# EasyEDA Pro project ZeroFactorySensorBoard_Board_DHT_2026-11-01.epro

# Schematic Schematic1
Board Name: Board_DHT; Create Date: 2026-02-08; Page Name: P1; Project Name: ZeroFactorySensorBoard; Schematic Name: Schematic1; Update Date: 2026-03-15; Company: EasyEDA.com; Page Size: A4; Version: V1.0
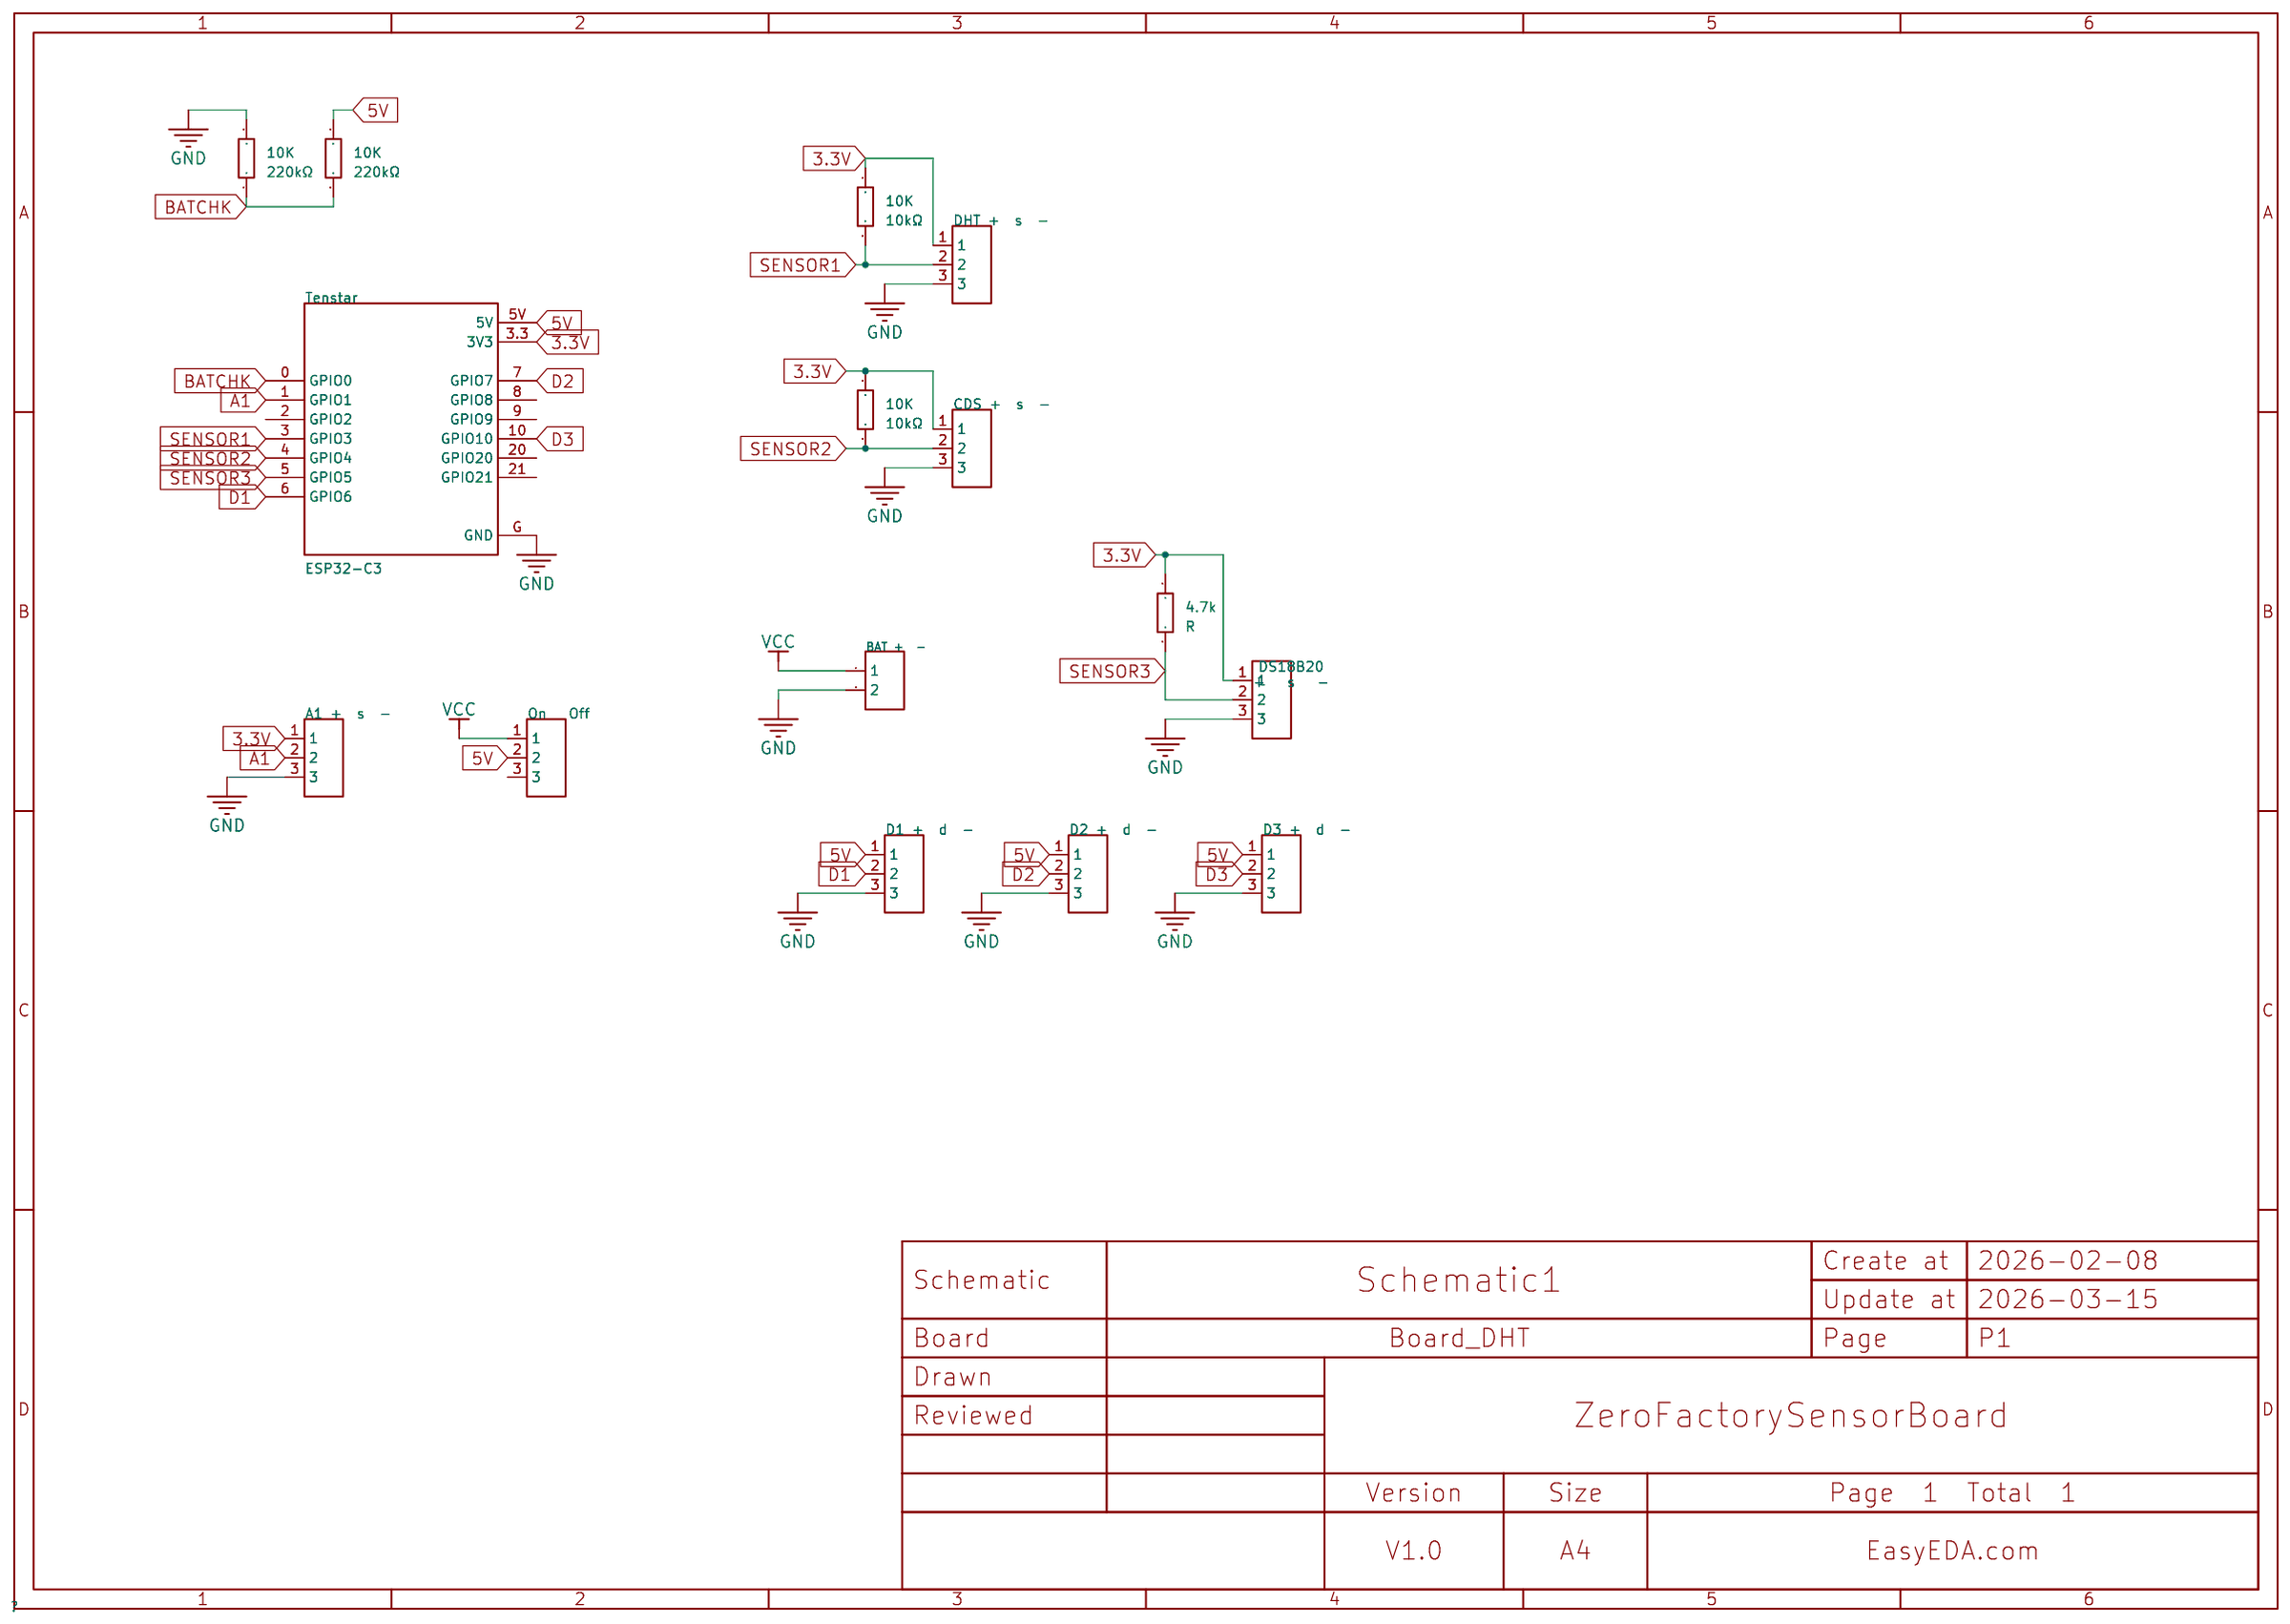
[diagram p0: schematic sheet]

## Parts
4.7k  4.7kΩ  [RES-TH_BD1.8-L3.2-P7.20-D0.4]
10K  10kΩ  [RES-TH_BD1.8-L3.2-P7.20-D0.4]
10K#2  10kΩ  [RES-TH_BD1.8-L3.2-P7.20-D0.4]
10K#3  220kΩ  [RES-TH_BD1.8-L3.2-P7.20-D0.4]
10K#4  220kΩ  [RES-TH_BD1.8-L3.2-P7.20-D0.4]
A1 +  s  -  -  [HDR-TH_3P-P2.54-V-F]
BAT +  -  -  [HDR-TH_2P-P2.54-V-F]
CDS +  s  -  -  [HDR-TH_3P-P2.54-V-M]
D1 +  d  -  -  [HDR-TH_3P-P2.54-V-F]
D2 +  d  -  -  [HDR-TH_3P-P2.54-V-F]
D3 +  d  -  -  [HDR-TH_3P-P2.54-V-F]
DHT +  s  -  -  [HDR-TH_3P-P2.54-V-M]
DS18B20
+   s   -  -  [HDR-TH_3P-P2.54-V-M]
On   Off  -  [HDR-TH_3P-P2.54-V-F]
Tenstar  ESP32-C3_SUPERMINI_TH  [ESP32-C3_SUPERMINI_TH:MODULE_ESP32-C3_SUPERMINI]

## Library data of the parts
4.7k 10K 10K#2-10K#4 = Res_AXIAL-1/8W: Supplier Footprint: Through
A1 +  s  - D1 +  d  - D2 +  d  - D3 +  d  - On   Off = HDR-F_2.54_1x3P: Supplier Footprint: Through
BAT +  - = HDR-F_2.54_1x2P: Supplier Footprint: Through
CDS +  s  - DHT +  s  - DS18B20
+   s   - = HDR-M_2.54_1x3P: Supplier Footprint: Through
Tenstar = ESP32-C3_SUPERMINI_TH_ESP32-C3_SUPERMINI_TH: MF: Espressif Systems; MAXIMUM_PACKAGE_HEIGHT: 4.2mm; Package1: Package; Price: None; Check_prices: https://www.snapeda.com/parts/ESP32-C3%20SuperMini_TH/Espressif+Systems/view-part/?ref=eda; STANDARD: Manufacturer Recommendations; SnapEDA_Link: https://www.snapeda.com/parts/ESP32-C3%20SuperMini_TH/Espressif+Systems/view-part/?ref=snap; MP: ESP32-C3 SuperMini_TH; Description_1: \n                        \n                            Super tiny ESP32-C3 board\n                        \n; Availability: Not in stock; MANUFACTURER: Espressif

## Nets
3.3V: 4.7k.2 10K.1 10K#2.1 A1 +  s  -.1 CDS +  s  -.1 DHT +  s  -.1 DS18B20
+   s   -.1 Tenstar.3.3(3V3)
5V: 10K#3.1 D1 +  d  -.1 D2 +  d  -.1 D3 +  d  -.1 On   Off.2 Tenstar.5V
GND: 10K#4.2 A1 +  s  -.3 BAT +  -.2 CDS +  s  -.3 D1 +  d  -.3 D2 +  d  -.3 D3 +  d  -.3 DHT +  s  -.3 DS18B20
+   s   -.3 Tenstar.G(GND)
VCC: BAT +  -.1 On   Off.1
A1: A1 +  s  -.2 Tenstar.1(GPIO1)
BATCHK: 10K#3.2 10K#4.1 Tenstar.0(GPIO0)
D1: D1 +  d  -.2 Tenstar.6(GPIO6)
D2: D2 +  d  -.2 Tenstar.7(GPIO7)
D3: D3 +  d  -.2 Tenstar.10(GPIO10)
SENSOR1: 10K.2 DHT +  s  -.2 Tenstar.3(GPIO3)
SENSOR2: 10K#2.2 CDS +  s  -.2 Tenstar.4(GPIO4)
SENSOR3: 4.7k.1 DS18B20
+   s   -.2 Tenstar.5(GPIO5)

Not connected (* = marked no-connect by the designer): On   Off 3; Tenstar 2(GPIO2) 8(GPIO8) 9(GPIO9) 20(GPIO20) 21(GPIO21)

# Board PCB1
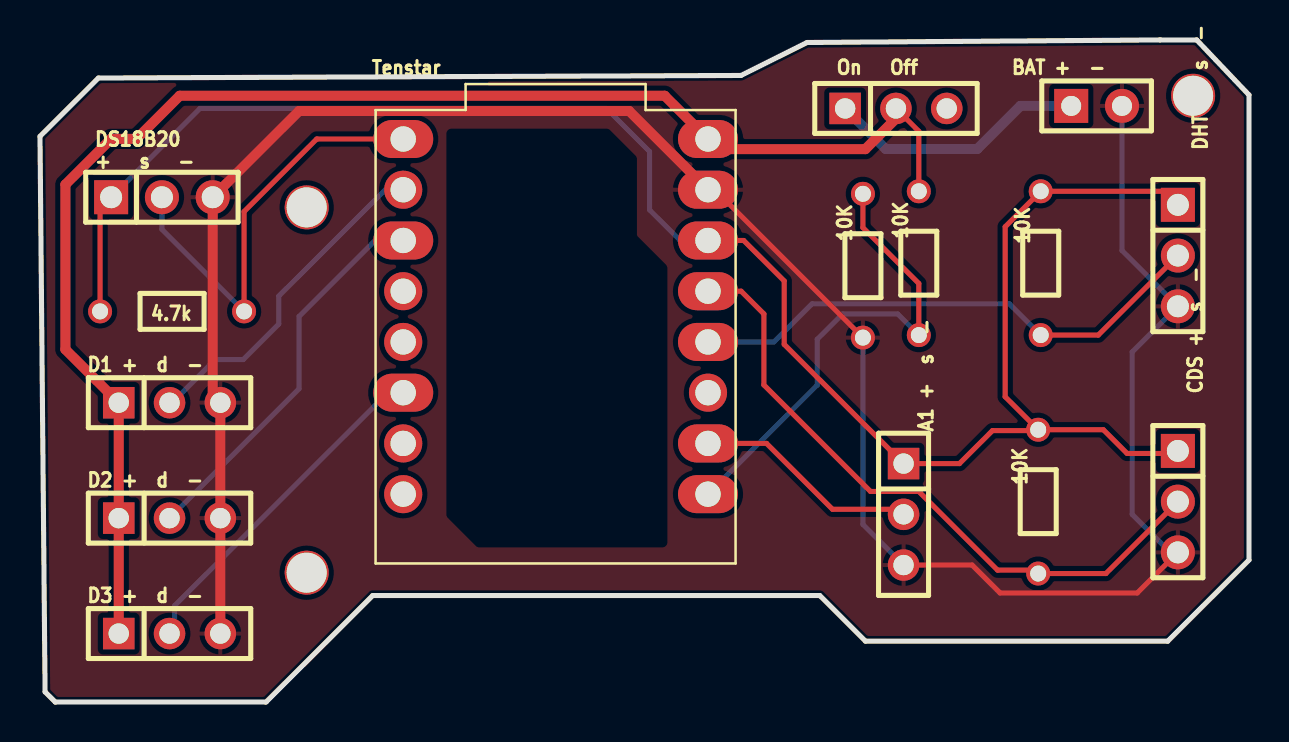
[diagram p1: board, top side]
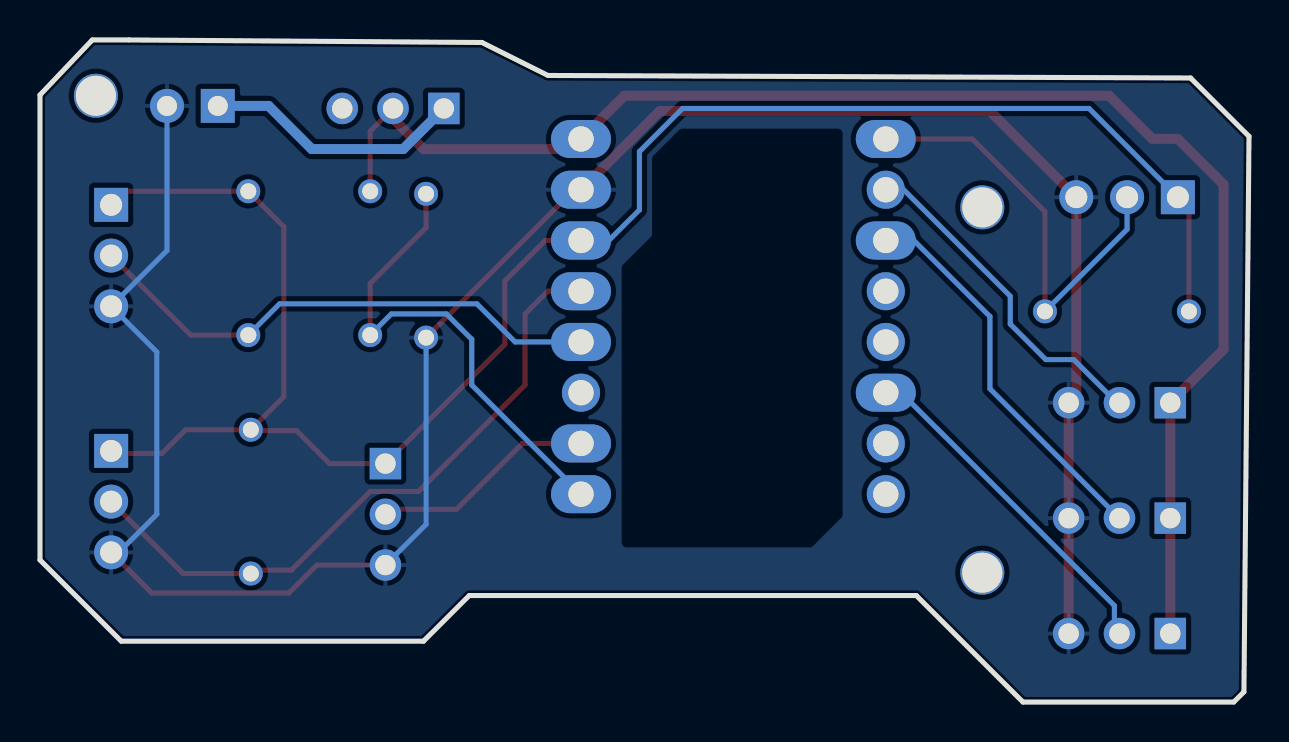
[diagram p2: board, bottom side, seen from below]

Outline 60.45 x 33.15 mm; copper layers: Top Layer, Bottom Layer. Coordinates in mm from the lower left corner of the outline.
Outline path: 0,28.32 2.92,31.24 35.05,31.37 38.35,33.02 56.01,33.15 57.84,33.15 60.45,30.39 60.45,7.11 56.39,3.05 41.28,3.05 38.99,5.33 16.64,5.33 11.3,0 0.76,0 0.25,0.51 0,28.32
Stack: Top Layer 0.035mm / Dielectric1 1.51mm FR4 er 4.5 / Bottom Layer 0.035mm

## Design rules (mm)
spacing copperThickness1oz (default): track to track 0.102, other pairs 0.152 to 0.3
spacing copperThickness2oz: track to track 0.203, other pairs 0.152 to 0.3
spacing Plane_innerPlane: track to track 0.102, other pairs 0.152 to 0.3
spacing Copper_copperRegion: track to track 0.102, other pairs 0.152 to 0.3
track width copperThickness1oz (default): min 0.127, default 0.254, max 2.54
track width copperThickness2oz: min 0.203, default 0.254, max 2.54
differential pair differentialPair (default): width min 0.127, default 0.254, max 2.54; gap min 0.152, default 0.152
net GND uses Copper_copperRegion, Plane_innerPlane
net SENSOR1 uses Copper_copperRegion, Plane_innerPlane
net 3.3V uses Copper_copperRegion, Plane_innerPlane
net A1 uses Copper_copperRegion, Plane_innerPlane
net SENSOR2 uses Copper_copperRegion, Plane_innerPlane
net SENSOR3 uses Copper_copperRegion, Plane_innerPlane
net 5V uses Copper_copperRegion, Plane_innerPlane
net D1 uses Copper_copperRegion, Plane_innerPlane
net D2 uses Copper_copperRegion, Plane_innerPlane
net D3 uses Copper_copperRegion, Plane_innerPlane
net VCC uses Copper_copperRegion, Plane_innerPlane
net BATCHK uses Copper_copperRegion, Plane_innerPlane
pour e118 uses Copper_copperRegion
pour e158 uses Copper_copperRegion

## Placement (name value [footprint] x y rotation side)
4.7k  4.7kΩ  [RES-TH_BD1.8-L3.2-P7.20-D0.4]  6.6 19.56 180 top
10K  10kΩ  [RES-TH_BD1.8-L3.2-P7.20-D0.4]  49.91 10.03 270 top
10K#2  10kΩ  [RES-TH_BD1.8-L3.2-P7.20-D0.4]  50.04 21.97 270 top
10K#3  220kΩ  [RES-TH_BD1.8-L3.2-P7.20-D0.4]  43.94 21.97 270 top
10K#4  220kΩ  [RES-TH_BD1.8-L3.2-P7.20-D0.4]  41.15 21.84 270 top
A1 +  s  -  -  [HDR-TH_3P-P2.54-V-F]  43.18 9.4 270 top
BAT +  -  -  [HDR-TH_2P-P2.54-V-F]  52.83 29.84 0 top
CDS +  s  -  -  [HDR-TH_3P-P2.54-V-M]  56.9 10.03 270 top
D1 +  d  -  -  [HDR-TH_3P-P2.54-V-F]  6.48 14.99 0 top
D2 +  d  -  -  [HDR-TH_3P-P2.54-V-F]  6.48 9.21 0 top
D3 +  d  -  -  [HDR-TH_3P-P2.54-V-F]  6.48 3.43 0 top
DHT +  s  -  -  [HDR-TH_3P-P2.54-V-M]  56.9 22.35 270 top
DS18B20
+   s   -  -  [HDR-TH_3P-P2.54-V-M]  6.1 25.27 0 top
NOREF  -  [Pad_e1]  57.66 30.35 0 top
NOREF#2  -  [Pad_e3]  13.34 24.77 0 top
NOREF#3  -  [Pad_e2]  13.34 6.48 0 top
On   Off  -  [HDR-TH_3P-P2.54-V-F]  42.8 29.72 0 top
Tenstar  ESP32-C3_SUPERMINI_TH  [ESP32-C3_SUPERMINI_TH:MODULE_ESP32-C3_SUPERMINI]  25.78 18.29 0 top

## Footprints (pads in the part's own frame, mm; a bottom-side part is the same pattern mirrored in y, then rotated)
ESP32-C3_SUPERMINI_TH:MODULE_ESP32-C3_SUPERMINI
  oval 3x1.905 hole 1.27: 0(7.62,-7.88) 1(7.62,-5.34) 3(7.62,-0.26) 3.3(7.62,4.82) 4(7.62,2.28) 5(-7.62,9.9) 5V(7.62,9.9) 7(-7.62,4.82) 10(-7.62,-2.8) G(7.62,7.36)
  round 1.905 hole 1.27: 2(7.62,-2.8) 6(-7.62,7.36) 8(-7.62,2.28) 9(-7.62,-0.26) 20(-7.62,-5.34) 21(-7.62,-7.88)
HDR-TH_2P-P2.54-V-F
  rect 1.7x1.7 hole 1: 1(-1.27,0)
  round 1.7 hole 1: 2(1.27,0)
HDR-TH_3P-P2.54-V-F
  rect 1.575x1.575 hole 1.02: 1(-2.54,0)
  round 1.575 hole 1.02: 2(0,0) 3(2.54,0)
HDR-TH_3P-P2.54-V-M
  rect 1.7x1.7 hole 1.1: 1(-2.54,0)
  round 1.7 hole 1.1: 2(0,0) 3(2.54,0)
Pad_e1
  round 2.2 hole 2: 1(0,0)
Pad_e2
  round 2.2 hole 2: 1(0,0)
Pad_e3
  round 2.2 hole 2: 1(0,0)
RES-TH_BD1.8-L3.2-P7.20-D0.4
  round 1.2 hole 0.8: 1(-3.6,0) 2(3.6,0)

## Nets
As in the schematic, except:
SENSOR1: 10K#2.2 DHT +  s  -.2 Tenstar.3
SENSOR2: 10K.2 CDS +  s  -.2 Tenstar.4

Pads without a net: NOREF 1; NOREF#2 1; NOREF#3 1; On   Off 3; Tenstar 2 8 9 20 21

## Routing (per net, layer and track width the routed paths; a pad name or vN(x,y) marks a point on that pad's centre or on a via; arc(x,y) is an arc through that point)
3.3V: length 93.8
  Top Layer w0.254: 10K.1 53.17,13.63 54.36,12.45 56.77,12.45 CDS +  s  -.1 ; 10K.1 48.26,15.28 48.26,23.79 10K#2.1 56.22,25.57 DHT +  s  -.1 ; 10K.1 49.87,13.59 47.62,13.59 45.97,11.94 A1 +  s  -.1 37.21,17.91 37.21,21.08 35.19,23.11 Tenstar.3.3 ; DS18B20
+   s   -.1 3,24.72 4.7k.2
  Bottom Layer w0.254: DS18B20
+   s   -.1 8,29.72 28.32,29.72 30.48,27.56 30.48,24.64 32.01,23.11 Tenstar.3.3
5V: length 73.8
  Top Layer w0.254: 10K#3.1 43.94,28.58 On   Off.2
  Top Layer w0.5: D3 +  d  -.1 D2 +  d  -.1 D1 +  d  -.1 1.27,17.65 1.27,25.91 3.56,28.19 4.83,28.19 6.98,30.35 31.24,30.35 Tenstar.5V 33.91,27.68 41.27,27.68 42.8,29.21 On   Off.2
GND: length 114
  Top Layer w0.254: A1 +  s  -.3 46.61,6.86 48.01,5.46 54.86,5.46 CDS +  s  -.3 ; Tenstar.G 33.74,25.65 10K#4.2
  Top Layer w0.5: D3 +  d  -.3 D2 +  d  -.3 D1 +  d  -.3 8.64,15.37 DS18B20
+   s   -.3 12.95,29.59 29.46,29.59 Tenstar.G
  Bottom Layer w0.254: BAT +  -.2 54.1,22.61 DHT +  s  -.3 54.61,17.53 54.61,9.4 56.51,7.49 CDS +  s  -.3 ; A1 +  s  -.3 41.15,8.89 10K#4.2
VCC: length 13
  Bottom Layer w0.5: On   Off.1 42.29,27.69 46.86,27.69 49.02,29.84 BAT +  -.1
A1: length 11.2
  Top Layer w0.254: A1 +  s  -.2 42.93,9.65 39.62,9.65 36.33,12.95 Tenstar.1
BATCHK: length 24.3
  Top Layer w0.254: 10K#3.2 43.94,20.95 41.15,23.75 10K#4.1
  Bottom Layer w0.254: Tenstar.0 38.86,15.87 38.86,18.16 40.13,19.43 42.88,19.43 10K#3.2
D1: length 16.9
  Bottom Layer w0.254: D1 +  d  -.2 6.6,14.99 8.76,17.14 10.16,17.14 11.94,18.92 11.94,20.32 17.27,25.65 Tenstar.6
D2: length 19.6
  Bottom Layer w0.254: Tenstar.7 16.76,23.11 12.95,19.3 12.95,15.68 D2 +  d  -.2
D3: length 17.3
  Bottom Layer w0.254: Tenstar.10 17.91,15.23 17.14,15.23 6.73,4.83 6.73,3.68 D3 +  d  -.2
SENSOR1: length 26.6
  Top Layer w0.254: DHT +  s  -.2 52.91,18.37 10K#2.2
  Bottom Layer w0.254: Tenstar.3 36.7,18.03 38.61,19.94 48.47,19.94 10K#2.2
SENSOR2: length 32.9
  Top Layer w0.254: Tenstar.4 35.06,20.57 36.19,19.43 36.19,15.88 41.53,10.54 43.94,10.54 47.88,6.6 49.74,6.6 10K.2 53.3,6.43 CDS +  s  -.2
SENSOR3: length 21.9
  Top Layer w0.254: Tenstar.5 13.84,28.19 10.2,24.55 4.7k.1
  Bottom Layer w0.254: 4.7k.1 6.1,23.67 DS18B20
+   s   -.2

## Copper pours and planes (outline as drawn; the poured copper is in the pictures)
GND on Top Layer: -1.02,33.53 60.96,33.53 60.96,-0.64 -1.02,-0.64
GND on Bottom Layer: -0.51,34.8 60.71,34.8 60.71,-0.13 -0.51,-0.13
